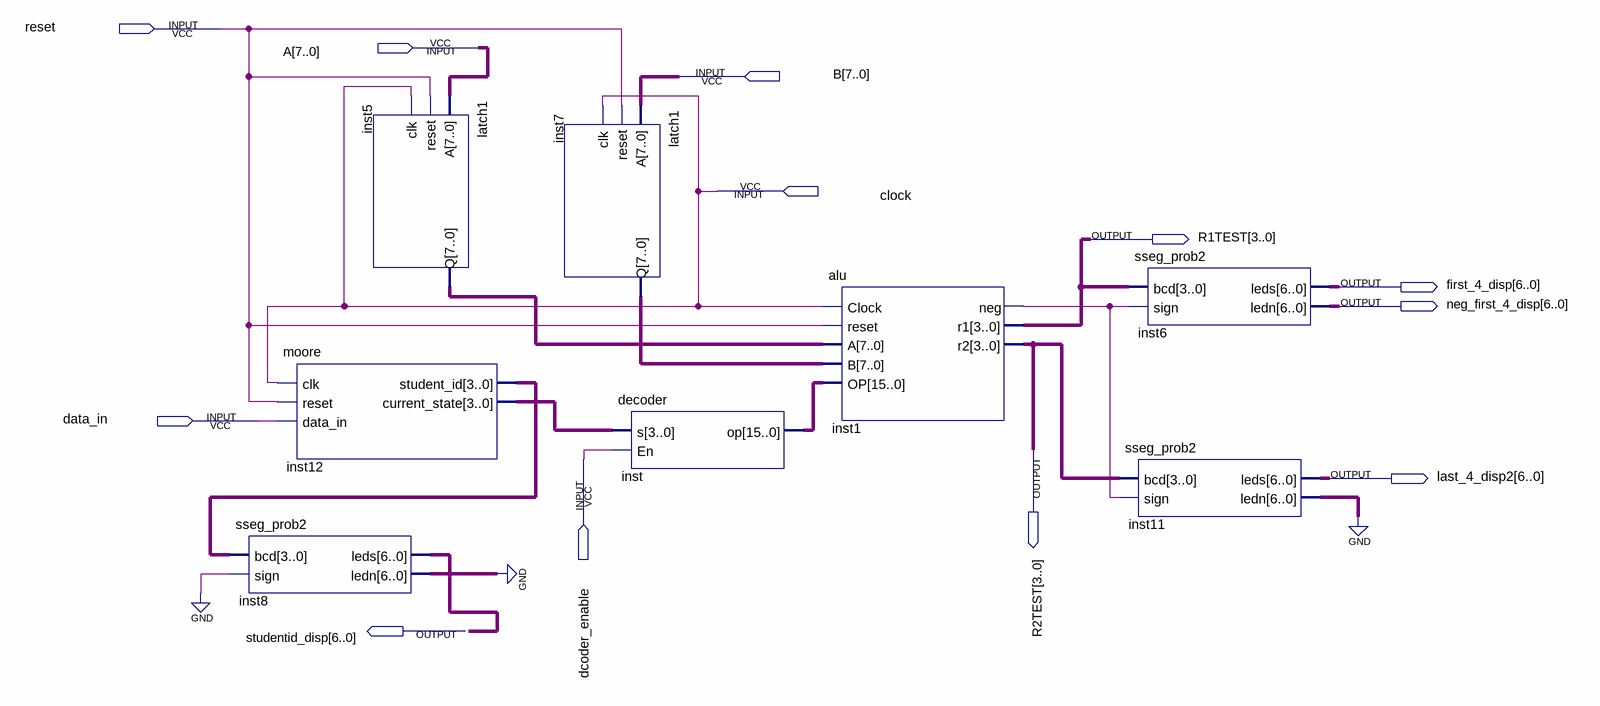
[diagram p0: schematic sheet]
// Quartus schematic alu_diagr.bdf as structural Verilog: 8 symbols, 12 pins
module alu_diagr (
  input  reset,
  input  [7:0] A,
  input  [7:0] B,
  input  clock,
  input  data_in,
  input  dcoder_enable,
  output [3:0] R1TEST,
  output [6:0] first_4_disp,
  output [6:0] neg_first_4_disp,
  output [3:0] R2TEST,
  output [6:0] last_4_disp2,
  output [6:0] studentid_disp
);

  wire inst1_neg;
  wire [3:0] inst12_current_state, inst12_student_id;
  wire [6:0] inst8_ledn, inst11_ledn;
  wire [7:0] inst5_q, inst7_q;
  wire [15:0] inst_op;

  moore inst12 (
    .clk(clock), .reset(reset), .data_in(data_in), .student_id(inst12_student_id),
    .current_state(inst12_current_state));
  sseg_prob2 inst8 (.bcd(inst12_student_id), .sign(1'b0), .leds(studentid_disp), .ledn(inst8_ledn));
  latch1 inst5 (.A(A), .reset(reset), .clk(clock), .Q(inst5_q));
  latch1 inst7 (.A(B), .reset(reset), .clk(clock), .Q(inst7_q));
  decoder inst (.s(inst12_current_state), .En(dcoder_enable), .op(inst_op));
  alu inst1 (
    .Clock(clock), .reset(reset), .A(inst5_q), .B(inst7_q), .OP(inst_op), .neg(inst1_neg), .r1(R1TEST),
    .r2(R2TEST));
  sseg_prob2 inst11 (.bcd(R2TEST), .sign(inst1_neg), .leds(last_4_disp2), .ledn(inst11_ledn));
  sseg_prob2 inst6 (.bcd(R1TEST), .sign(inst1_neg), .leds(first_4_disp), .ledn(neg_first_4_disp));
  // also tied to GND on the sheet: {inst8_ledn[0], inst8_ledn[1], inst8_ledn[2], inst8_ledn[3], inst8_ledn[4], inst8_ledn[5], inst8_ledn[6], inst11_ledn[0], inst11_ledn[1], inst11_ledn[2], inst11_ledn[3], inst11_ledn[4], inst11_ledn[5], inst11_ledn[6]}
endmodule
